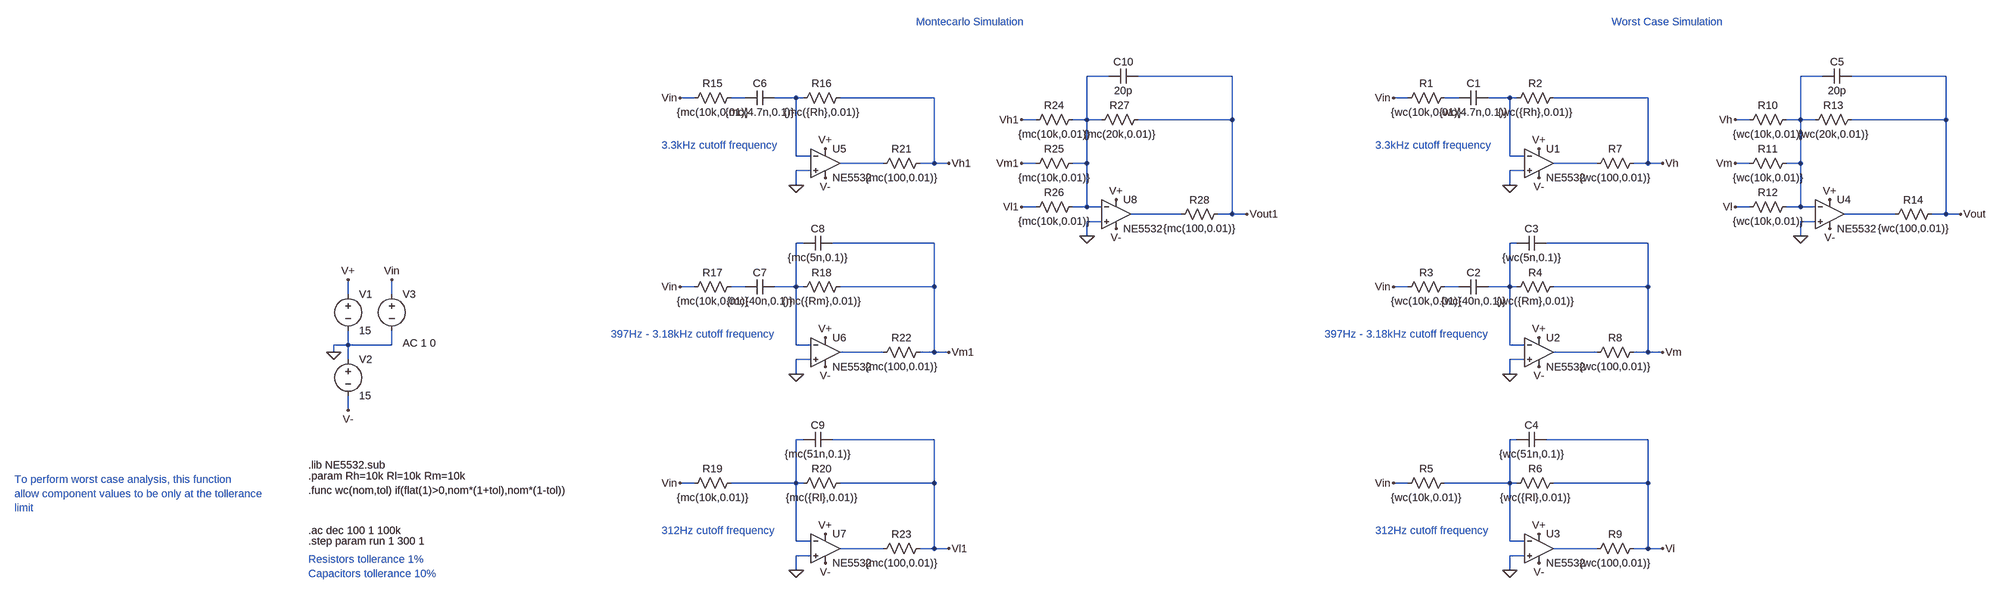
[diagram p0: schematic AudioMixer - 3bEq.asc]
AudioMixer - 3bEq.asc, the LTspice schematic file:
Version 4.1
SHEET 1 3204 2084
WIRE 992 -464 944 -464
WIRE 1264 -464 1056 -464
WIRE 2816 -464 2768 -464
WIRE 3088 -464 2880 -464
WIRE 80 -416 48 -416
WIRE 192 -416 160 -416
WIRE 304 -416 256 -416
WIRE 320 -416 304 -416
WIRE 608 -416 400 -416
WIRE 1904 -416 1872 -416
WIRE 2016 -416 1984 -416
WIRE 2128 -416 2080 -416
WIRE 2144 -416 2128 -416
WIRE 2432 -416 2224 -416
WIRE 832 -368 800 -368
WIRE 944 -368 944 -464
WIRE 944 -368 912 -368
WIRE 976 -368 944 -368
WIRE 1264 -368 1264 -464
WIRE 1264 -368 1056 -368
WIRE 2656 -368 2624 -368
WIRE 2768 -368 2768 -464
WIRE 2768 -368 2736 -368
WIRE 2800 -368 2768 -368
WIRE 3088 -368 3088 -464
WIRE 3088 -368 2880 -368
WIRE 304 -288 304 -416
WIRE 336 -288 304 -288
WIRE 2128 -288 2128 -416
WIRE 2160 -288 2128 -288
WIRE 496 -272 400 -272
WIRE 608 -272 608 -416
WIRE 608 -272 576 -272
WIRE 640 -272 608 -272
WIRE 832 -272 800 -272
WIRE 944 -272 944 -368
WIRE 944 -272 912 -272
WIRE 2320 -272 2224 -272
WIRE 2432 -272 2432 -416
WIRE 2432 -272 2400 -272
WIRE 2464 -272 2432 -272
WIRE 2656 -272 2624 -272
WIRE 2768 -272 2768 -368
WIRE 2768 -272 2736 -272
WIRE 336 -256 304 -256
WIRE 2160 -256 2128 -256
WIRE 304 -224 304 -256
WIRE 2128 -224 2128 -256
WIRE 832 -176 800 -176
WIRE 944 -176 944 -272
WIRE 944 -176 912 -176
WIRE 976 -176 944 -176
WIRE 2656 -176 2624 -176
WIRE 2768 -176 2768 -272
WIRE 2768 -176 2736 -176
WIRE 2800 -176 2768 -176
WIRE 1152 -160 1040 -160
WIRE 1264 -160 1264 -368
WIRE 1264 -160 1232 -160
WIRE 1296 -160 1264 -160
WIRE 2976 -160 2864 -160
WIRE 3088 -160 3088 -368
WIRE 3088 -160 3056 -160
WIRE 3120 -160 3088 -160
WIRE 976 -144 944 -144
WIRE 2800 -144 2768 -144
WIRE 944 -112 944 -144
WIRE 2768 -112 2768 -144
WIRE 320 -96 304 -96
WIRE 608 -96 384 -96
WIRE 2144 -96 2128 -96
WIRE 2432 -96 2208 -96
WIRE 80 0 48 0
WIRE 192 0 160 0
WIRE 304 0 304 -96
WIRE 304 0 256 0
WIRE 320 0 304 0
WIRE 608 0 608 -96
WIRE 608 0 400 0
WIRE 1904 0 1872 0
WIRE 2016 0 1984 0
WIRE 2128 0 2128 -96
WIRE 2128 0 2080 0
WIRE 2144 0 2128 0
WIRE 2432 0 2432 -96
WIRE 2432 0 2224 0
WIRE -832 16 -832 -16
WIRE -736 16 -736 -16
WIRE -832 128 -832 96
WIRE -832 128 -864 128
WIRE -736 128 -736 96
WIRE -736 128 -832 128
WIRE 304 128 304 0
WIRE 336 128 304 128
WIRE 2128 128 2128 0
WIRE 2160 128 2128 128
WIRE -864 144 -864 128
WIRE 496 144 400 144
WIRE 608 144 608 0
WIRE 608 144 576 144
WIRE 640 144 608 144
WIRE 2320 144 2224 144
WIRE 2432 144 2432 0
WIRE 2432 144 2400 144
WIRE 2464 144 2432 144
WIRE -832 160 -832 128
WIRE 336 160 304 160
WIRE 2160 160 2128 160
WIRE 304 192 304 160
WIRE 2128 192 2128 160
WIRE -832 272 -832 240
WIRE 320 336 304 336
WIRE 608 336 384 336
WIRE 2144 336 2128 336
WIRE 2432 336 2208 336
WIRE 80 432 48 432
WIRE 304 432 304 336
WIRE 304 432 160 432
WIRE 320 432 304 432
WIRE 608 432 608 336
WIRE 608 432 400 432
WIRE 1904 432 1872 432
WIRE 2128 432 2128 336
WIRE 2128 432 1984 432
WIRE 2144 432 2128 432
WIRE 2432 432 2432 336
WIRE 2432 432 2224 432
WIRE 304 560 304 432
WIRE 336 560 304 560
WIRE 2128 560 2128 432
WIRE 2160 560 2128 560
WIRE 496 576 400 576
WIRE 608 576 608 432
WIRE 608 576 576 576
WIRE 640 576 608 576
WIRE 2320 576 2224 576
WIRE 2432 576 2432 432
WIRE 2432 576 2400 576
WIRE 2464 576 2432 576
WIRE 336 592 304 592
WIRE 2160 592 2128 592
WIRE 304 624 304 592
WIRE 2128 624 2128 592
FLAG -864 144 0
FLAG -832 -16 V+
FLAG -832 272 V-
FLAG -736 -16 Vin
FLAG 368 -304 V+
FLAG 368 -240 V-
FLAG 48 -416 Vin
FLAG 640 -272 Vh1
FLAG 304 -224 0
FLAG 368 112 V+
FLAG 368 176 V-
FLAG 48 0 Vin
FLAG 304 192 0
FLAG 368 544 V+
FLAG 368 608 V-
FLAG 48 432 Vin
FLAG 304 624 0
FLAG 1008 -192 V+
FLAG 1008 -128 V-
FLAG 944 -112 0
FLAG 640 144 Vm1
FLAG 640 576 Vl1
FLAG 1296 -160 Vout1
FLAG 800 -368 Vh1
FLAG 800 -272 Vm1
FLAG 800 -176 Vl1
FLAG 2192 -304 V+
FLAG 2192 -240 V-
FLAG 1872 -416 Vin
FLAG 2464 -272 Vh
FLAG 2128 -224 0
FLAG 2192 112 V+
FLAG 2192 176 V-
FLAG 1872 0 Vin
FLAG 2128 192 0
FLAG 2192 544 V+
FLAG 2192 608 V-
FLAG 1872 432 Vin
FLAG 2128 624 0
FLAG 2832 -192 V+
FLAG 2832 -128 V-
FLAG 2768 -112 0
FLAG 2464 144 Vm
FLAG 2464 576 Vl
FLAG 3120 -160 Vout
FLAG 2624 -368 Vh
FLAG 2624 -272 Vm
FLAG 2624 -176 Vl
SYMBOL voltage -832 0 R0
SYMATTR InstName V1
SYMATTR Value 15
SYMBOL voltage -832 144 R0
SYMATTR InstName V2
SYMATTR Value 15
SYMBOL voltage -736 0 R0
WINDOW 123 24 124 Left 2
WINDOW 39 0 0 Left 0
SYMATTR Value2 AC 1 0
SYMATTR InstName V3
SYMATTR Value ""
SYMBOL res 176 -432 R90
WINDOW 0 0 56 VBottom 2
WINDOW 3 32 56 VTop 2
SYMATTR InstName R15
SYMATTR Value {mc(10k,0.01)}
SYMBOL cap 256 -432 R90
WINDOW 0 0 32 VBottom 2
WINDOW 3 32 32 VTop 2
SYMATTR InstName C6
SYMATTR Value {mc(4.7n,0.1)}
SYMBOL res 416 -432 R90
WINDOW 0 0 56 VBottom 2
WINDOW 3 32 56 VTop 2
SYMATTR InstName R16
SYMATTR Value {mc({Rh},0.01)}
SYMBOL res 176 -16 R90
WINDOW 0 0 56 VBottom 2
WINDOW 3 32 56 VTop 2
SYMATTR InstName R17
SYMATTR Value {mc(10k,0.01)}
SYMBOL cap 256 -16 R90
WINDOW 0 0 32 VBottom 2
WINDOW 3 32 32 VTop 2
SYMATTR InstName C7
SYMATTR Value {mc(40n,0.1)}
SYMBOL res 416 -16 R90
WINDOW 0 0 56 VBottom 2
WINDOW 3 32 56 VTop 2
SYMATTR InstName R18
SYMATTR Value {mc({Rm},0.01)}
SYMBOL cap 384 -112 R90
WINDOW 0 0 32 VBottom 2
WINDOW 3 32 32 VTop 2
SYMATTR InstName C8
SYMATTR Value {mc(5n,0.1)}
SYMBOL res 176 416 R90
WINDOW 0 0 56 VBottom 2
WINDOW 3 32 56 VTop 2
SYMATTR InstName R19
SYMATTR Value {mc(10k,0.01)}
SYMBOL res 416 416 R90
WINDOW 0 0 56 VBottom 2
WINDOW 3 32 56 VTop 2
SYMATTR InstName R20
SYMATTR Value {mc({Rl},0.01)}
SYMBOL cap 384 320 R90
WINDOW 0 0 32 VBottom 2
WINDOW 3 32 32 VTop 2
SYMATTR InstName C9
SYMATTR Value {mc(51n,0.1)}
SYMBOL res 592 -288 R90
WINDOW 0 0 56 VBottom 2
WINDOW 3 32 56 VTop 2
SYMATTR InstName R21
SYMATTR Value {mc(100,0.01)}
SYMBOL res 592 128 R90
WINDOW 0 0 56 VBottom 2
WINDOW 3 32 56 VTop 2
SYMATTR InstName R22
SYMATTR Value {mc(100,0.01)}
SYMBOL res 592 560 R90
WINDOW 0 0 56 VBottom 2
WINDOW 3 32 56 VTop 2
SYMATTR InstName R23
SYMATTR Value {mc(100,0.01)}
SYMBOL res 928 -384 R90
WINDOW 0 0 56 VBottom 2
WINDOW 3 32 56 VTop 2
SYMATTR InstName R24
SYMATTR Value {mc(10k,0.01)}
SYMBOL res 928 -288 R90
WINDOW 0 0 56 VBottom 2
WINDOW 3 32 56 VTop 2
SYMATTR InstName R25
SYMATTR Value {mc(10k,0.01)}
SYMBOL res 928 -192 R90
WINDOW 0 0 56 VBottom 2
WINDOW 3 32 56 VTop 2
SYMATTR InstName R26
SYMATTR Value {mc(10k,0.01)}
SYMBOL res 1072 -384 R90
WINDOW 0 0 56 VBottom 2
WINDOW 3 32 56 VTop 2
SYMATTR InstName R27
SYMATTR Value {mc(20k,0.01)}
SYMBOL cap 1056 -480 R90
WINDOW 0 0 32 VBottom 2
WINDOW 3 32 32 VTop 2
SYMATTR InstName C10
SYMATTR Value 20p
SYMBOL res 1248 -176 R90
WINDOW 0 0 56 VBottom 2
WINDOW 3 32 56 VTop 2
SYMATTR InstName R28
SYMATTR Value {mc(100,0.01)}
SYMBOL OpAmps\\opamp2 368 -336 R0
SYMATTR InstName U5
SYMATTR Value NE5532
SYMBOL OpAmps\\opamp2 368 80 R0
SYMATTR InstName U6
SYMATTR Value NE5532
SYMBOL OpAmps\\opamp2 368 512 R0
SYMATTR InstName U7
SYMATTR Value NE5532
SYMBOL OpAmps\\opamp2 1008 -224 R0
SYMATTR InstName U8
SYMATTR Value NE5532
SYMBOL res 2000 -432 R90
WINDOW 0 0 56 VBottom 2
WINDOW 3 32 56 VTop 2
SYMATTR InstName R1
SYMATTR Value {wc(10k,0.01)}
SYMBOL cap 2080 -432 R90
WINDOW 0 0 32 VBottom 2
WINDOW 3 32 32 VTop 2
SYMATTR InstName C1
SYMATTR Value {wc(4.7n,0.1)}
SYMBOL res 2240 -432 R90
WINDOW 0 0 56 VBottom 2
WINDOW 3 32 56 VTop 2
SYMATTR InstName R2
SYMATTR Value {wc({Rh},0.01)}
SYMBOL res 2000 -16 R90
WINDOW 0 0 56 VBottom 2
WINDOW 3 32 56 VTop 2
SYMATTR InstName R3
SYMATTR Value {wc(10k,0.01)}
SYMBOL cap 2080 -16 R90
WINDOW 0 0 32 VBottom 2
WINDOW 3 32 32 VTop 2
SYMATTR InstName C2
SYMATTR Value {wc(40n,0.1)}
SYMBOL res 2240 -16 R90
WINDOW 0 0 56 VBottom 2
WINDOW 3 32 56 VTop 2
SYMATTR InstName R4
SYMATTR Value {wc({Rm},0.01)}
SYMBOL cap 2208 -112 R90
WINDOW 0 0 32 VBottom 2
WINDOW 3 32 32 VTop 2
SYMATTR InstName C3
SYMATTR Value {wc(5n,0.1)}
SYMBOL res 2000 416 R90
WINDOW 0 0 56 VBottom 2
WINDOW 3 32 56 VTop 2
SYMATTR InstName R5
SYMATTR Value {wc(10k,0.01)}
SYMBOL res 2240 416 R90
WINDOW 0 0 56 VBottom 2
WINDOW 3 32 56 VTop 2
SYMATTR InstName R6
SYMATTR Value {wc({Rl},0.01)}
SYMBOL cap 2208 320 R90
WINDOW 0 0 32 VBottom 2
WINDOW 3 32 32 VTop 2
SYMATTR InstName C4
SYMATTR Value {wc(51n,0.1)}
SYMBOL res 2416 -288 R90
WINDOW 0 0 56 VBottom 2
WINDOW 3 32 56 VTop 2
SYMATTR InstName R7
SYMATTR Value {wc(100,0.01)}
SYMBOL res 2416 128 R90
WINDOW 0 0 56 VBottom 2
WINDOW 3 32 56 VTop 2
SYMATTR InstName R8
SYMATTR Value {wc(100,0.01)}
SYMBOL res 2416 560 R90
WINDOW 0 0 56 VBottom 2
WINDOW 3 32 56 VTop 2
SYMATTR InstName R9
SYMATTR Value {wc(100,0.01)}
SYMBOL res 2752 -384 R90
WINDOW 0 0 56 VBottom 2
WINDOW 3 32 56 VTop 2
SYMATTR InstName R10
SYMATTR Value {wc(10k,0.01)}
SYMBOL res 2752 -288 R90
WINDOW 0 0 56 VBottom 2
WINDOW 3 32 56 VTop 2
SYMATTR InstName R11
SYMATTR Value {wc(10k,0.01)}
SYMBOL res 2752 -192 R90
WINDOW 0 0 56 VBottom 2
WINDOW 3 32 56 VTop 2
SYMATTR InstName R12
SYMATTR Value {wc(10k,0.01)}
SYMBOL res 2896 -384 R90
WINDOW 0 0 56 VBottom 2
WINDOW 3 32 56 VTop 2
SYMATTR InstName R13
SYMATTR Value {wc(20k,0.01)}
SYMBOL cap 2880 -480 R90
WINDOW 0 0 32 VBottom 2
WINDOW 3 32 32 VTop 2
SYMATTR InstName C5
SYMATTR Value 20p
SYMBOL res 3072 -176 R90
WINDOW 0 0 56 VBottom 2
WINDOW 3 32 56 VTop 2
SYMATTR InstName R14
SYMATTR Value {wc(100,0.01)}
SYMBOL OpAmps\\opamp2 2192 -336 R0
SYMATTR InstName U1
SYMATTR Value NE5532
SYMBOL OpAmps\\opamp2 2192 80 R0
SYMATTR InstName U2
SYMATTR Value NE5532
SYMBOL OpAmps\\opamp2 2192 512 R0
SYMATTR InstName U3
SYMATTR Value NE5532
SYMBOL OpAmps\\opamp2 2832 -224 R0
SYMATTR InstName U4
SYMATTR Value NE5532
TEXT -920 536 Left 2 !.ac dec 100 1 100k
TEXT -920 416 Left 2 !.param Rh=10k Rl=10k Rm=10k
TEXT -920 560 Left 2 !.step param run 1 300 1
TEXT -920 392 Left 2 !.lib NE5532.sub
TEXT 8 -312 Left 2 ;3.3kHz cutoff frequency
TEXT -104 104 Left 2 ;397Hz - 3.18kHz cutoff frequency
TEXT 8 536 Left 2 ;312Hz cutoff frequency
TEXT -920 600 Left 2 ;Resistors tollerance 1%\nCapacitors tollerance 10%
TEXT 1832 -312 Left 2 ;3.3kHz cutoff frequency
TEXT 1720 104 Left 2 ;397Hz - 3.18kHz cutoff frequency
TEXT 1832 536 Left 2 ;312Hz cutoff frequency
TEXT -920 448 Left 2 !.func wc(nom,tol) if(flat(1)>0,nom*(1+tol),nom*(1-tol))
TEXT -1568 424 Left 2 ;To perform worst case analysis, this function\nallow component values to be only at the tollerance\nlimit
TEXT 568 -584 Left 2 ;Montecarlo Simulation
TEXT 2352 -584 Left 2 ;Worst Case Simulation

The netlist it stands for:
* AudioMixer - 3bEq.asc
V1 V+ 0 15
V2 0 V- 15
V3 Vin 0 AC 1 0
R15 N003 Vin {mc(10k,0.01)}
C6 N004 N003 {mc(4.7n,0.1)}
R16 Vh1 N004 {mc({Rh},0.01)}
R17 N013 Vin {mc(10k,0.01)}
C7 N011 N013 {mc(40n,0.1)}
R18 Vm1 N011 {mc({Rm},0.01)}
C8 Vm1 N011 {mc(5n,0.1)}
R19 N017 Vin {mc(10k,0.01)}
R20 Vl1 N017 {mc({Rl},0.01)}
C9 Vl1 N017 {mc(51n,0.1)}
R21 Vh1 N007 {mc(100,0.01)}
R22 Vm1 N015 {mc(100,0.01)}
R23 Vl1 N019 {mc(100,0.01)}
R24 N001 Vh1 {mc(10k,0.01)}
R25 N001 Vm1 {mc(10k,0.01)}
R26 N001 Vl1 {mc(10k,0.01)}
R27 Vout1 N001 {mc(20k,0.01)}
C10 Vout1 N001 20p
R28 Vout1 N009 {mc(100,0.01)}
X§U5 0 N004 V+ V- N007 NE5532  ; pins In+ In- V+ V- OUT
X§U6 0 N011 V+ V- N015 NE5532  ; pins In+ In- V+ V- OUT
X§U7 0 N017 V+ V- N019 NE5532  ; pins In+ In- V+ V- OUT
X§U8 0 N001 V+ V- N009 NE5532  ; pins In+ In- V+ V- OUT
R1 N005 Vin {wc(10k,0.01)}
C1 N006 N005 {wc(4.7n,0.1)}
R2 Vh N006 {wc({Rh},0.01)}
R3 N014 Vin {wc(10k,0.01)}
C2 N012 N014 {wc(40n,0.1)}
R4 Vm N012 {wc({Rm},0.01)}
C3 Vm N012 {wc(5n,0.1)}
R5 N018 Vin {wc(10k,0.01)}
R6 Vl N018 {wc({Rl},0.01)}
C4 Vl N018 {wc(51n,0.1)}
R7 Vh N008 {wc(100,0.01)}
R8 Vm N016 {wc(100,0.01)}
R9 Vl N020 {wc(100,0.01)}
R10 N002 Vh {wc(10k,0.01)}
R11 N002 Vm {wc(10k,0.01)}
R12 N002 Vl {wc(10k,0.01)}
R13 Vout N002 {wc(20k,0.01)}
C5 Vout N002 20p
R14 Vout N010 {wc(100,0.01)}
X§U1 0 N006 V+ V- N008 NE5532  ; pins In+ In- V+ V- OUT
X§U2 0 N012 V+ V- N016 NE5532  ; pins In+ In- V+ V- OUT
X§U3 0 N018 V+ V- N020 NE5532  ; pins In+ In- V+ V- OUT
X§U4 0 N002 V+ V- N010 NE5532  ; pins In+ In- V+ V- OUT
.ac dec 100 1 100k
.param Rh=10k Rl=10k Rm=10k
.step param run 1 300 1
.lib NE5532.sub
* 3.3kHz cutoff frequency
* 397Hz - 3.18kHz cutoff frequency
* 312Hz cutoff frequency
* Resistors tollerance 1%
* Capacitors tollerance 10%
* 3.3kHz cutoff frequency
* 397Hz - 3.18kHz cutoff frequency
* 312Hz cutoff frequency
.func wc(nom,tol) if(flat(1)>0,nom*(1+tol),nom*(1-tol))
* To perform worst case analysis, this function
* allow component values to be only at the tollerance
* limit
* Montecarlo Simulation
* Worst Case Simulation
.backanno
.end